# Altium schematic sheet Proiect Dina.SchDoc
size A; SheetNumber: 1; SheetTotal: 1
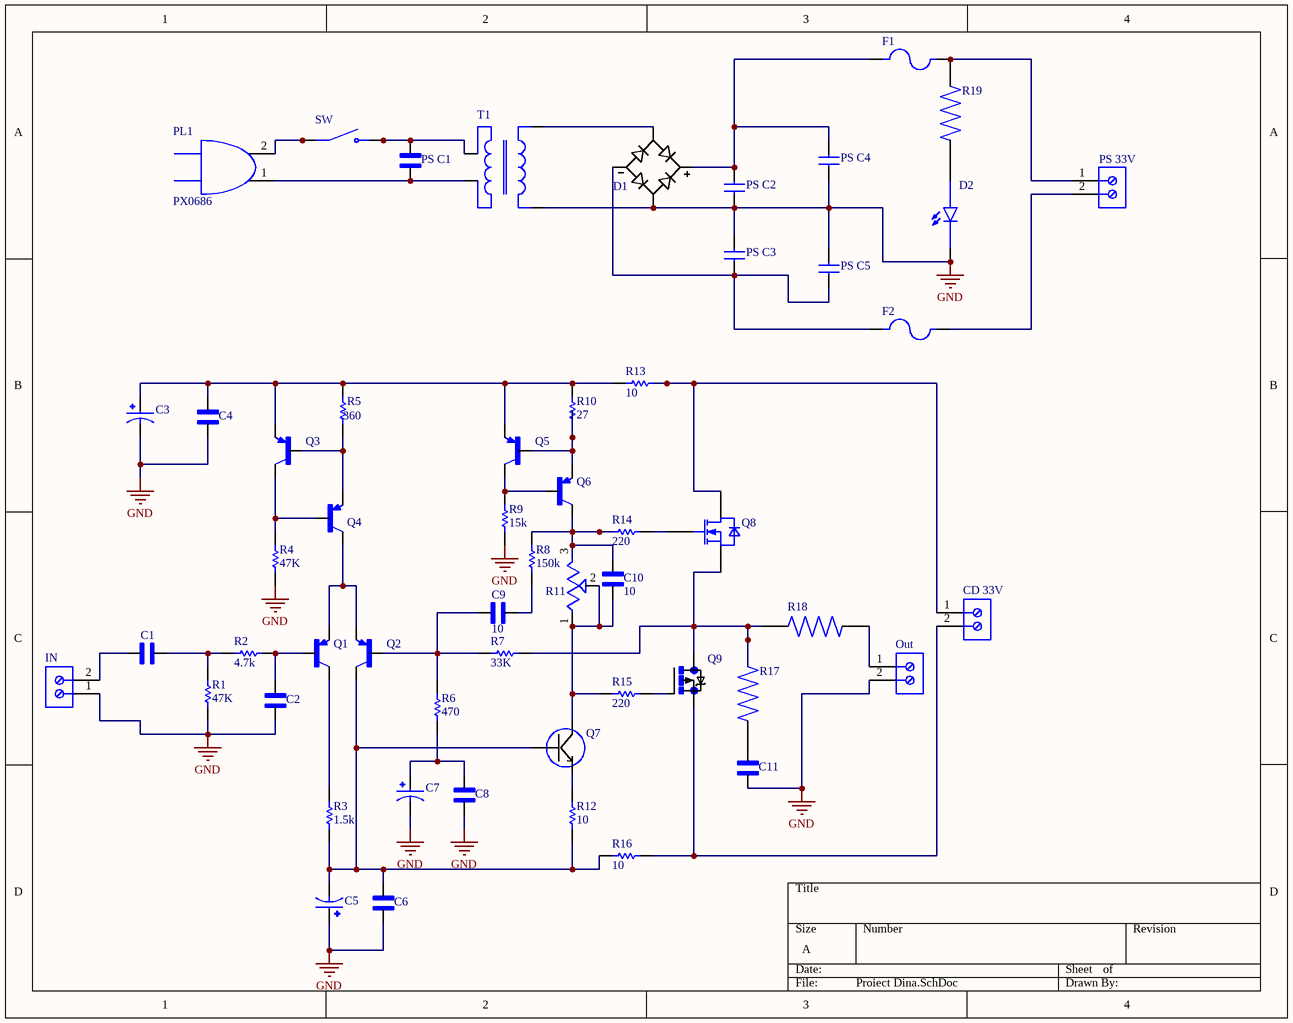
[diagram p0: Proiect Dina.SchDoc]

## Parts
C1  R82EC3470AA70K10  [CAPC3216X160N]  (value not drawn)
C2  R82EC3470AA70K10  [CAPC3216X160N]  (value not drawn)
C3  EEVTG1J471M  [CAP_EEVTG1J471M]  (value not drawn)
C4  R82EC3470AA70K10  [CAPC3216X160N]  (value not drawn)
C5  EEVTG1J471M  [CAP_EEVTG1J471M]  (value not drawn)
C6  R82EC3470AA70K10  [CAPC3216X160N]  (value not drawn)
C7  EEVTG1J471M  [CAP_EEVTG1J471M]  (value not drawn)
C8  R82EC3470AA70K10  [CAPC3216X160N]  (value not drawn)
C9  10  [CAPC3216X160N]
C10  10  [CAPC3216X160N]
C11  R82EC3470AA70K10  [CAPC3216X160N]  (value not drawn)
CD_33V  282836-2  [TECO-282836-2_V]  (value not drawn)
D1  GBU8G  [*DIOB_GBU8G_GBU8G(Primary)]  (value not drawn)
D2  WP7113ID  [LED_WP7113ID]  (value not drawn)
F1  36913150000  [FUSE_36913150000]  (value not drawn)
F2  36913150000  [FUSE_36913150000]  (value not drawn)
IN  282836-2  [TECO-282836-2_V]  (value not drawn)
Out  282836-2  [TECO-282836-2_V]  (value not drawn)
PL1  PX0686  [PL1]
PS_33V  282836-2  [TECO-282836-2_V]  (value not drawn)
PS_C1  CL32C103JIJNNWE  [CAPC3225X270N]  (value not drawn)
PS_C2  WCAP-ASNP_8X10.5  [WCAP-ASNP_8X10.5(DXL)]  (value not drawn)
PS_C3  WCAP-ASNP_8X10.5  [WCAP-ASNP_8X10.5(DXL)]  (value not drawn)
PS_C4  WCAP-ASNP_8X10.5  [WCAP-ASNP_8X10.5(DXL)]  (value not drawn)
PS_C5  WCAP-ASNP_8X10.5  [WCAP-ASNP_8X10.5(DXL)]  (value not drawn)
Q1  BC860C  [SOT95P240X120-3N]  (value not drawn)
Q2  BC860C  [SOT95P240X120-3N]  (value not drawn)
Q3  BC860C  [SOT95P240X120-3N]  (value not drawn)
Q4  BC860C  [SOT95P240X120-3N]  (value not drawn)
Q5  BC860C  [SOT95P240X120-3N]  (value not drawn)
Q6  BD140  [TO229P760X270X1364-3]  (value not drawn)
Q7  BD139  [*TO-126]  (value not drawn)
Q8  IRF540N  [IFX-PG-TO220-3-904-1]  (value not drawn)
Q9  IRF9540NS  [*D2PACK]  (value not drawn)
R1  47K  [RESC3216X60X45LL10T20]
R2  4.7k  [RESC3216X60X45ML15T20]
R3  1.5k  [RESC3216X60X45ML15T20]
R4  47K  [RESC3216X60X45LL10T20]
R5  360  [RESC3216X60X45ML15T20]
R6  470  [RESC3216X60X45ML15T20]
R7  33K  [RESC3216X60X45ML15T20]
R8  150k  [RESC3216X60X45ML15T20]
R9  15k  [RESC3216X60X45ML15T20]
R10  27  [RESC3216X60X45ML15T20]
R11  3269W-1-102LF  [TRIM_3269W-1-102LF]  (value not drawn)
R12  10  [RESC3216X60X45ML15T20]
R13  10  [RESC3216X60X45ML15T20]
R14  220  [RESC3216X60X45ML15T20]
R15  220  [RESC3216X60X45ML15T20]
R16  10  [RESC3216X60X45ML15T20]
R17  CRM2512-JW-8R2ELF  [RESC6331X80N]  (value not drawn)
R18  CRM2512-JW-8R2ELF  [RESC6331X80N]  (value not drawn)
R19  CR2010-JW-222ELF  [RESC5025X70N]  (value not drawn)
SW  EVQ-P7A01P  [SW_EVQ-P7A01P]  (value not drawn)
T1  BV EI 306 3366  [T1]  (value not drawn)

## Nets
GND: C2.1 C3.2 C4.1 C5.1 C6.1 C7.2 C8.1 C11.1 D1.AC1 D2.C IN.1 Out.2 PS_C2.1 PS_C3.2 PS_C4.1 PS_C5.2 R1.1 R4.1 R9.1 T1.5
NetC1_1: C1.1 IN.2
NetC1_2: C1.2 R1.2 R2.1
NetC2_2: C2.2 Q1.1(B) R2.2
NetC3_1: C3.1 C4.2 Q3.2(E) Q5.2(E) R5.2 R10.2 R13.1
NetC5_2: C5.2 C6.2 Q2.3(C) Q7.3(B) R3.1 R12.1 R16.1
NetC7_1: C7.1 C8.2 R6.1
NetC9_1: C9.1 Q2.1(B) R6.2 R7.1
NetC9_2: C9.2 R8.1
NetC10_1: C10.1 Q7.2(C) R11.1(CCW) R11.2(WIPER) R15.1
NetC10_2: C10.2 Q6.2(C) R8.2 R11.3(CW) R14.1
NetC11_2: C11.2 R17.1
NetCD_33V_1: CD_33V.1 Q8.2(DRAIN) R13.2
NetCD_33V_2: CD_33V.2 Q9.2(S) R16.2
NetD1_AC2: D1.AC2 T1.1
NetD1_NEG: D1.NEG F2.1 PS_C3.1 PS_C5.1
NetD1_POS: D1.POS F1.1 PS_C2.2 PS_C4.2
NetD2_A: D2.A R19.1
NetF1_2: F1.2 PS_33V.1 R19.2
NetF2_2: F2.2 PS_33V.2
NetOut_1: Out.1 R18.2
NetPL1_1: PL1.1 PS_C1.1 T1.7
NetPL1_2: PL1.2 SW.1_1 SW.1_2
NetPS_C1_2: PS_C1.2 SW.2_1 SW.2_2 T1.9
NetQ1_2: Q1.2(E) Q2.2(E) Q4.3(C)
NetQ1_3: Q1.3(C) R3.2
NetQ3_1: Q3.1(B) Q4.2(E) R5.1
NetQ3_3: Q3.3(C) Q4.1(B) R4.2
NetQ5_1: Q5.1(B) Q6.1(E) R10.1
NetQ5_3: Q5.3(C) Q6.3(B) R9.2
NetQ7_1: Q7.1(E) R12.2
NetQ8_1: Q8.1(GATE) R14.2
NetQ8_3: Q8.3(SOURCE) Q9.3(D) R7.2 R17.2 R18.1
NetQ9_1: Q9.1(G) R15.2

## Library data of the parts
C1 C2 C4 C6 C8-C11 = 1206Y0630100KCR: CAP CER 10PF 63V C0G/NP0 1206; MF: Knowles Syfer; SnapEDA_Link: https://www.snapeda.com/parts/1206Y0630100KCR/Knowles+Syfer/view-part/?ref=snap; Package: 3216 Knowles Syfer; Value: *; MP: 1206Y0630100KCR; Check_prices: https://www.snapeda.com/parts/1206Y0630100KCR/Knowles+Syfer/view-part/?ref=eda
C3 C5 C7 = EEVTG1J471M: 470ÂµF 63V Aluminum Electrolytic Capacitors Radial, Can - SMD 180mOhm @ 100kHz 2000 Hrs @ 125Â°C; MP: EEV-TG1J471M; MF: Panasonic; Package: RADIAL-2 Panasonic; Purchase-URL: https://pricing.snapeda.com/search/part/EEV-TG1J471M/?ref=eda; Check_prices: https://www.snapeda.com/parts/EEV-TG1J471M/Panasonic/view-part/2306879/?ref=eda; Value: *; SnapEDA_Link: https://www.snapeda.com/parts/EEV-TG1J471M/Panasonic/view-part/2306879/?ref=snap; Price: None; Availability: In Stock
CD_33V IN Out PS_33V = CMP-1684-00017-1: Female Header, Pitch 5 mm, 1 x 2 Position, Height 10 mm, Tail Length 3.5 mm, Rohs, Bulk; Manufacturer: TE Connectivity; Wire Gauge: 16-30AWG; Product Training Modules: Wire-to-BoardEurostyleTerminalBlocks; Clamp Material - Plating: Brass-NickelPlated; Voltage: 300V; Mating Orientation: HorizontalwithBoard; Current: 13.5A; Pitch: 0.197"(5.00mm); Screw Thread: M3; 3D Model: 282836-2.pdf; Other Names: 5ULV-02B / A98076; Dynamic Catalog: BuchananSeries; Number of Levels: 1; Torque - Screw: 0.68Nm(6Lb-In); Featured Product: EurostyleTerminalBlockConnectors; Positions Per Level: 2; Wire Termination: Screw-RisingCageClamp; Datasheet URL: http://www.te.com.cn/commerce/DocumentDelivery/DDEController?Action=showdoc&DocId=Catalog+Section%7F1308389_EUROSTYLE_TERMINAL_BLOCKS%7F0607%7Fpdf%7FEnglish%7FENG_CS_1308389_EUROSTYLE_TERMINAL_BLOCKS_0607.pdf%7F282836-2; Color: Green; Family: TerminalBlocks-WiretoBoard; RoHS Information: 282836-2StatementofCompliance; Standard Package: 300; Contact Material - Plating: Brass-TinPlated; Manufacturer URL: http://www.te.com; Housing Material: Polyamide(PA66),Nylon6/6; Features: Interlocking(Side); Package Description: Female Header, Pitch 5 mm, 1 x 2 Position, Height 10 mm, Tail Length 3.5 mm; Mounting Type: ThroughHole; Package Reference: THD; Packaging: Bulk; Series: Buchanan; Category: Connectors,Interconnects; Screw Material - Plating: Brass-NickelPlated
D2 = WP7113ID: Red 617nm LED Indication - Discrete 2V Radial; MF: Kingbright; Price: None; MP: WP7113ID; Package: Radial Kingbright; Check_prices: https://www.snapeda.com/parts/WP7113ID/Kingbright/view-part/?ref=eda; Purchase-URL: https://pricing.snapeda.com/search/part/WP7113ID/?ref=eda; Availability: In Stock; Value: *; SnapEDA_Link: https://www.snapeda.com/parts/WP7113ID/Kingbright/view-part/?ref=snap
F1 F2 = 36913150000: 3.15 A 300 V AC DC Fuse Board Mount (Cartridge Style Excluded) Through Hole Radial, Box; MF: Littelfuse; SnapEDA_Link: https://www.snapeda.com/parts/36913150000/Littelfuse/view-part/?ref=snap; Package: None; Value: *; MP: 36913150000; Check_prices: https://www.snapeda.com/parts/36913150000/Littelfuse/view-part/?ref=eda
PS_C1 = CL32C103JIJNNWE: Multilayer Ceramic Capacitors MLCC - SMD/SMT 1210/3225,C0G,10nF,1000V,+/-5%; MF: Samsung; SnapEDA_Link: https://www.snapeda.com/parts/CL32C103JIJNNWE/Samsung/view-part/?ref=snap; Package: SMD-2 Samsung; Value: *; MP: CL32C103JIJNNWE; Check_prices: https://www.snapeda.com/parts/CL32C103JIJNNWE/Samsung/view-part/?ref=eda
PS_C2-PS_C5 = WCAP-ASNP_8X10.5: CAP ALUM 22UF 20% 50V SMD; MF: WÃ¼rth Elektronik; MP: 865250653010; SnapEDA_Link: https://www.snapeda.com/parts/865250653010/W%25C3%25BCrth+Elektronik+Midcom/view-part/?ref=snap; Package: Radial WÃ¼rth Elektronik; Value: *; Check_prices: https://www.snapeda.com/parts/865250653010/W%25C3%25BCrth+Elektronik+Midcom/view-part/?ref=eda
Q1-Q5 = BC860C: BJT, SOT-23, 45V, 100mA, PNP, 0.25W, 150Â°C; MF: Diotec Semiconductor; SnapEDA_Link: https://www.snapeda.com/parts/BC860C/Diotec/view-part/?ref=snap; Package: SOT-23 Diotec; Value: *; MP: BC860C; Check_prices: https://www.snapeda.com/parts/BC860C/Diotec/view-part/?ref=eda
Q6 = BD140: Bipolar (BJT) Transistor PNP 80 V 1.5 A - 1.25 W Through Hole TO-126-3; MF: ON Semiconductor; SnapEDA_Link: https://www.snapeda.com/parts/BD140/Onsemi/view-part/?ref=snap; Package: TO-225-3 ON Semiconductor; Value: *; MP: BD140; Check_prices: https://www.snapeda.com/parts/BD140/Onsemi/view-part/?ref=eda
Q7 = BD139: Bipolar (BJT) Transistor NPN 80 V 1.5 A - 1.25 W Through Hole SOT-32-3; MF: STMicroelectronics; SnapEDA_Link: https://www.snapeda.com/parts/BD139/STMicroelectronics/view-part/?ref=snap; Package: TO-126 STMicroelectronics; MP: BD139; Check_prices: https://www.snapeda.com/parts/BD139/STMicroelectronics/view-part/?ref=eda; Value: *
Q8 = IRF540N: Insulated-Gate Field-Effect Transistor (IGFET), N-Channel, Enhancement, Body Diode, Pin 1 Gate, 2 Drain, 3 Source, 3 Pins; Manufacturer: Infineon Technologies; Manufacturer Order Number: IRF540N; PackageReference: PG-TO220-3-904
Q9 = IRF9540NS: P-Channel 100V 23A (Tc) 3.1W (Ta), 110W (Tc) Surface Mount D2PAK; MF: International Rectifier; SnapEDA_Link: https://www.snapeda.com/parts/IRF9540NS/International+Rectifier/view-part/?ref=snap; Package: TO-263 International Rectifier; MP: IRF9540NS; Check_prices: https://www.snapeda.com/parts/IRF9540NS/International+Rectifier/view-part/?ref=eda; Value: *
R1 R4 = CMP-2003-02213-1: Part Number: CRCW120647K0FKEA; Manufacturer: Vishay Dale
R2 = CMP-2100-03618-1: Chip Resistor, 4.7 KOhm, +/- 1%, 0.25 W, -55 to 155 degC, 1206 (3216 Metric), RoHS, Tape and Reel; Manufacturer: Vishay Semiconductor; Power Rating: 250mW; Voltage Rating: 200V; Temperature Coefficient: 100ppm/degreesC; Package Quantity: 10; Composition: ThickFilm; REACH SVHC: Unknown; Mount: SurfaceMount; Max Operating Temperature: 155degC; Length: 3.2mm; Number of Terminations: 2; Case Code (Metric): 3216; Military Standard: Not; Width: 1.6mm; Datasheet Version: 41061.0; Max Power Dissipation: 250mW; Datasheet URL: http://www.vishay.com/docs/20035/dcrcwe3.pdf; Contact Plating: Tin; Case/Package: 1206; Height: 0.55mm; Package Reference: 1206.0; Lead Free: LeadFree; Weight: 0.000353oz; Package Description: 2-Pin Surface Mount Device, Body 3.15 x 1.6 mm; Min Operating Temperature: -55degC; Resistance: 4.7KOhm; Packaging: TapeandReel; Depth: 1.6mm; Tolerance: 1%; RoHSCompliant: true; Termination: SMD/SMT; Case Code (Imperial): 1206; Voltage Rating (DC): 200V; Radiation Hardening: No; Manufacturer URL: http://www.vishay.com/
R3 = CMP-2100-03618-1: Chip Resistor, 4.7 KOhm, +/- 1%, 0.25 W, -55 to 155 degC, 1206 (3216 Metric), RoHS, Tape and Reel; Manufacturer: Vishay Semiconductor; Power Rating: 250mW; Voltage Rating: 200V; Temperature Coefficient: 100ppm/degreesC; Resistance: 1.5KOhm; Package Quantity: 10; Composition: ThickFilm; REACH SVHC: Unknown; Mount: SurfaceMount; Max Operating Temperature: 155degC; Length: 3.2mm; Number of Terminations: 2; Case Code (Metric): 3216; Military Standard: Not; Width: 1.6mm; Datasheet Version: 41061.0; Max Power Dissipation: 250mW; Datasheet URL: http://www.vishay.com/docs/20035/dcrcwe3.pdf; Contact Plating: Tin; Case/Package: 1206; Height: 0.55mm; Package Reference: 1206.0; Lead Free: LeadFree; Weight: 0.000353oz; Package Description: 2-Pin Surface Mount Device, Body 3.15 x 1.6 mm; Min Operating Temperature: -55degC; Packaging: TapeandReel; Depth: 1.6mm; Tolerance: 1%; RoHSCompliant: true; Termination: SMD/SMT; Case Code (Imperial): 1206; Voltage Rating (DC): 200V; Radiation Hardening: No; Manufacturer URL: http://www.vishay.com/
R5 = CMP-2100-03618-1: Chip Resistor, 4.7 KOhm, +/- 1%, 0.25 W, -55 to 155 degC, 1206 (3216 Metric), RoHS, Tape and Reel; Manufacturer: Vishay Semiconductor; Power Rating: 250mW; Voltage Rating: 200V; Temperature Coefficient: 100ppm/degreesC; Resistance: 360Ohm; Package Quantity: 10; Composition: ThickFilm; REACH SVHC: Unknown; Mount: SurfaceMount; Max Operating Temperature: 155degC; Length: 3.2mm; Number of Terminations: 2; Case Code (Metric): 3216; Military Standard: Not; Width: 1.6mm; Datasheet Version: 41061.0; Max Power Dissipation: 250mW; Datasheet URL: http://www.vishay.com/docs/20035/dcrcwe3.pdf; Contact Plating: Tin; Case/Package: 1206; Height: 0.55mm; Package Reference: 1206.0; Lead Free: LeadFree; Weight: 0.000353oz; Package Description: 2-Pin Surface Mount Device, Body 3.15 x 1.6 mm; Min Operating Temperature: -55degC; Packaging: TapeandReel; Depth: 1.6mm; Tolerance: 1%; RoHSCompliant: true; Termination: SMD/SMT; Case Code (Imperial): 1206; Voltage Rating (DC): 200V; Radiation Hardening: No; Manufacturer URL: http://www.vishay.com/
R6 = CMP-2100-03618-1: Chip Resistor, 4.7 KOhm, +/- 1%, 0.25 W, -55 to 155 degC, 1206 (3216 Metric), RoHS, Tape and Reel; Manufacturer: Vishay Semiconductor; Power Rating: 250mW; Voltage Rating: 200V; Temperature Coefficient: 100ppm/degreesC; Resistance: 470Ohm; Package Quantity: 10; Composition: ThickFilm; REACH SVHC: Unknown; Mount: SurfaceMount; Max Operating Temperature: 155degC; Length: 3.2mm; Number of Terminations: 2; Case Code (Metric): 3216; Military Standard: Not; Width: 1.6mm; Datasheet Version: 41061.0; Max Power Dissipation: 250mW; Datasheet URL: http://www.vishay.com/docs/20035/dcrcwe3.pdf; Contact Plating: Tin; Case/Package: 1206; Height: 0.55mm; Package Reference: 1206.0; Lead Free: LeadFree; Weight: 0.000353oz; Package Description: 2-Pin Surface Mount Device, Body 3.15 x 1.6 mm; Min Operating Temperature: -55degC; Packaging: TapeandReel; Depth: 1.6mm; Tolerance: 1%; RoHSCompliant: true; Termination: SMD/SMT; Case Code (Imperial): 1206; Voltage Rating (DC): 200V; Radiation Hardening: No; Manufacturer URL: http://www.vishay.com/
R7 = CMP-2100-03618-1: Chip Resistor, 4.7 KOhm, +/- 1%, 0.25 W, -55 to 155 degC, 1206 (3216 Metric), RoHS, Tape and Reel; Manufacturer: Vishay Semiconductor; Power Rating: 250mW; Voltage Rating: 200V; Temperature Coefficient: 100ppm/degreesC; Resistance: 33KOhm; Package Quantity: 10; Composition: ThickFilm; REACH SVHC: Unknown; Mount: SurfaceMount; Max Operating Temperature: 155degC; Length: 3.2mm; Number of Terminations: 2; Case Code (Metric): 3216; Military Standard: Not; Width: 1.6mm; Datasheet Version: 41061.0; Max Power Dissipation: 250mW; Datasheet URL: http://www.vishay.com/docs/20035/dcrcwe3.pdf; Contact Plating: Tin; Case/Package: 1206; Height: 0.55mm; Package Reference: 1206.0; Lead Free: LeadFree; Weight: 0.000353oz; Package Description: 2-Pin Surface Mount Device, Body 3.15 x 1.6 mm; Min Operating Temperature: -55degC; Packaging: TapeandReel; Depth: 1.6mm; Tolerance: 1%; RoHSCompliant: true; Termination: SMD/SMT; Case Code (Imperial): 1206; Voltage Rating (DC): 200V; Radiation Hardening: No; Manufacturer URL: http://www.vishay.com/
R8 = CMP-2100-03618-1: Chip Resistor, 4.7 KOhm, +/- 1%, 0.25 W, -55 to 155 degC, 1206 (3216 Metric), RoHS, Tape and Reel; Manufacturer: Vishay Semiconductor; Power Rating: 250mW; Voltage Rating: 200V; Temperature Coefficient: 100ppm/degreesC; Resistance: 150KOhm; Package Quantity: 10; Composition: ThickFilm; REACH SVHC: Unknown; Mount: SurfaceMount; Max Operating Temperature: 155degC; Length: 3.2mm; Number of Terminations: 2; Case Code (Metric): 3216; Military Standard: Not; Width: 1.6mm; Datasheet Version: 41061.0; Max Power Dissipation: 250mW; Datasheet URL: http://www.vishay.com/docs/20035/dcrcwe3.pdf; Contact Plating: Tin; Case/Package: 1206; Height: 0.55mm; Package Reference: 1206.0; Lead Free: LeadFree; Weight: 0.000353oz; Package Description: 2-Pin Surface Mount Device, Body 3.15 x 1.6 mm; Min Operating Temperature: -55degC; Packaging: TapeandReel; Depth: 1.6mm; Tolerance: 1%; RoHSCompliant: true; Termination: SMD/SMT; Case Code (Imperial): 1206; Voltage Rating (DC): 200V; Radiation Hardening: No; Manufacturer URL: http://www.vishay.com/
R9 = CMP-2100-03618-1: Chip Resistor, 4.7 KOhm, +/- 1%, 0.25 W, -55 to 155 degC, 1206 (3216 Metric), RoHS, Tape and Reel; Manufacturer: Vishay Semiconductor; Power Rating: 250mW; Voltage Rating: 200V; Temperature Coefficient: 100ppm/degreesC; Resistance: 15KOhm; Package Quantity: 10; Composition: ThickFilm; REACH SVHC: Unknown; Mount: SurfaceMount; Max Operating Temperature: 155degC; Length: 3.2mm; Number of Terminations: 2; Case Code (Metric): 3216; Military Standard: Not; Width: 1.6mm; Datasheet Version: 41061.0; Max Power Dissipation: 250mW; Datasheet URL: http://www.vishay.com/docs/20035/dcrcwe3.pdf; Contact Plating: Tin; Case/Package: 1206; Height: 0.55mm; Package Reference: 1206.0; Lead Free: LeadFree; Weight: 0.000353oz; Package Description: 2-Pin Surface Mount Device, Body 3.15 x 1.6 mm; Min Operating Temperature: -55degC; Packaging: TapeandReel; Depth: 1.6mm; Tolerance: 1%; RoHSCompliant: true; Termination: SMD/SMT; Case Code (Imperial): 1206; Voltage Rating (DC): 200V; Radiation Hardening: No; Manufacturer URL: http://www.vishay.com/
R10 = CMP-2100-03618-1: Chip Resistor, 4.7 KOhm, +/- 1%, 0.25 W, -55 to 155 degC, 1206 (3216 Metric), RoHS, Tape and Reel; Manufacturer: Vishay Semiconductor; Power Rating: 250mW; Voltage Rating: 200V; Temperature Coefficient: 100ppm/degreesC; Resistance: 27Ohm; Package Quantity: 10; Composition: ThickFilm; REACH SVHC: Unknown; Mount: SurfaceMount; Max Operating Temperature: 155degC; Length: 3.2mm; Number of Terminations: 2; Case Code (Metric): 3216; Military Standard: Not; Width: 1.6mm; Datasheet Version: 41061.0; Max Power Dissipation: 250mW; Datasheet URL: http://www.vishay.com/docs/20035/dcrcwe3.pdf; Contact Plating: Tin; Case/Package: 1206; Height: 0.55mm; Package Reference: 1206.0; Lead Free: LeadFree; Weight: 0.000353oz; Package Description: 2-Pin Surface Mount Device, Body 3.15 x 1.6 mm; Min Operating Temperature: -55degC; Packaging: TapeandReel; Depth: 1.6mm; Tolerance: 1%; RoHSCompliant: true; Termination: SMD/SMT; Case Code (Imperial): 1206; Voltage Rating (DC): 200V; Radiation Hardening: No; Manufacturer URL: http://www.vishay.com/
R11 = 3269W-1-102LF: 1/4 Sq, SMD, TRIMMER, Cermet, 12 Turns, 1 Kilohms | Bourns 3269W-1-102LF; SnapEDA_Link: https://www.snapeda.com/parts/3269W-1-102LF/Bourns/view-part/?ref=snap; Package: SMD-3 Bourns; Value: *; MF: Bourns; MP: 3269W-1-102LF; Check_prices: https://www.snapeda.com/parts/3269W-1-102LF/Bourns/view-part/?ref=eda
R12 R13 R16 = CMP-2100-03618-1: Chip Resistor, 4.7 KOhm, +/- 1%, 0.25 W, -55 to 155 degC, 1206 (3216 Metric), RoHS, Tape and Reel; Manufacturer: Vishay Semiconductor; Power Rating: 250mW; Voltage Rating: 200V; Temperature Coefficient: 100ppm/degreesC; Resistance: 10Ohm; Package Quantity: 10; Composition: ThickFilm; REACH SVHC: Unknown; Mount: SurfaceMount; Max Operating Temperature: 155degC; Length: 3.2mm; Number of Terminations: 2; Case Code (Metric): 3216; Military Standard: Not; Width: 1.6mm; Datasheet Version: 41061.0; Max Power Dissipation: 250mW; Datasheet URL: http://www.vishay.com/docs/20035/dcrcwe3.pdf; Contact Plating: Tin; Case/Package: 1206; Height: 0.55mm; Package Reference: 1206.0; Lead Free: LeadFree; Weight: 0.000353oz; Package Description: 2-Pin Surface Mount Device, Body 3.15 x 1.6 mm; Min Operating Temperature: -55degC; Packaging: TapeandReel; Depth: 1.6mm; Tolerance: 1%; RoHSCompliant: true; Termination: SMD/SMT; Case Code (Imperial): 1206; Voltage Rating (DC): 200V; Radiation Hardening: No; Manufacturer URL: http://www.vishay.com/
R14 R15 = CMP-2100-03618-1: Chip Resistor, 4.7 KOhm, +/- 1%, 0.25 W, -55 to 155 degC, 1206 (3216 Metric), RoHS, Tape and Reel; Manufacturer: Vishay Semiconductor; Power Rating: 250mW; Voltage Rating: 200V; Temperature Coefficient: 100ppm/degreesC; Resistance: 220Ohm; Package Quantity: 10; Composition: ThickFilm; REACH SVHC: Unknown; Mount: SurfaceMount; Max Operating Temperature: 155degC; Length: 3.2mm; Number of Terminations: 2; Case Code (Metric): 3216; Military Standard: Not; Width: 1.6mm; Datasheet Version: 41061.0; Max Power Dissipation: 250mW; Datasheet URL: http://www.vishay.com/docs/20035/dcrcwe3.pdf; Contact Plating: Tin; Case/Package: 1206; Height: 0.55mm; Package Reference: 1206.0; Lead Free: LeadFree; Weight: 0.000353oz; Package Description: 2-Pin Surface Mount Device, Body 3.15 x 1.6 mm; Min Operating Temperature: -55degC; Packaging: TapeandReel; Depth: 1.6mm; Tolerance: 1%; RoHSCompliant: true; Termination: SMD/SMT; Case Code (Imperial): 1206; Voltage Rating (DC): 200V; Radiation Hardening: No; Manufacturer URL: http://www.vishay.com/
R17 R18 = CRM2512-JW-8R2ELF: 8.2 Ohms Â±5% 2W Chip Resistor 2512 (6432 Metric) Current Sense Thick Film; MF: Bourns; Purchase-URL: https://pricing.snapeda.com/search/part/CRM2512-JW-8R2ELF/?ref=eda; SnapEDA_Link: https://www.snapeda.com/parts/CRM2512-JW-8R2ELF/Bourns/view-part/?ref=snap; Package: 6331 Bourns; Value: *; MP: CRM2512-JW-8R2ELF; Check_prices: https://www.snapeda.com/parts/CRM2512-JW-8R2ELF/Bourns/view-part/?ref=eda; Digi-Key_Part_Number: 118-CRM2512-JW-8R2ELFTR-ND
R19 = CR2010-JW-222ELF: 2.2 kOhms Â±5% 0.5W, 1/2W Chip Resistor 2010 (5025 Metric) Thick Film; MF: Bourns; SnapEDA_Link: https://www.snapeda.com/parts/CR2010-JW-222ELF/Bourns/view-part/?ref=snap; Package: 5025 Bourns; Value: *; MP: CR2010-JW-222ELF; Check_prices: https://www.snapeda.com/parts/CR2010-JW-222ELF/Bourns/view-part/?ref=eda
SW = EVQ-P7A01P: Switch;Tactile;3.5x2.9mm;Right Angle;Light Touch Switch | Panasonic Electronic Components EVQ-P7A01P; SnapEDA_Link: https://www.snapeda.com/parts/EVQ-P7A01P/Panasonic+Electronic+Components/view-part/?ref=snap; Package: None; Value: *; MF: Panasonic Electronic Components; MP: EVQ-P7A01P; Check_prices: https://www.snapeda.com/parts/EVQ-P7A01P/Panasonic+Electronic+Components/view-part/?ref=eda
D1 = GBU8G: SnapEDA_Link: https://www.snapeda.com/parts/GBU8G/Diotec/view-part/?ref=snap; Check_prices: https://www.snapeda.com/parts/GBU8G/Diotec/view-part/?ref=eda; Value: *